# Altium schematic sheet Breakout.SchDoc
size A4; SheetNumber: 1; SheetTotal: 1
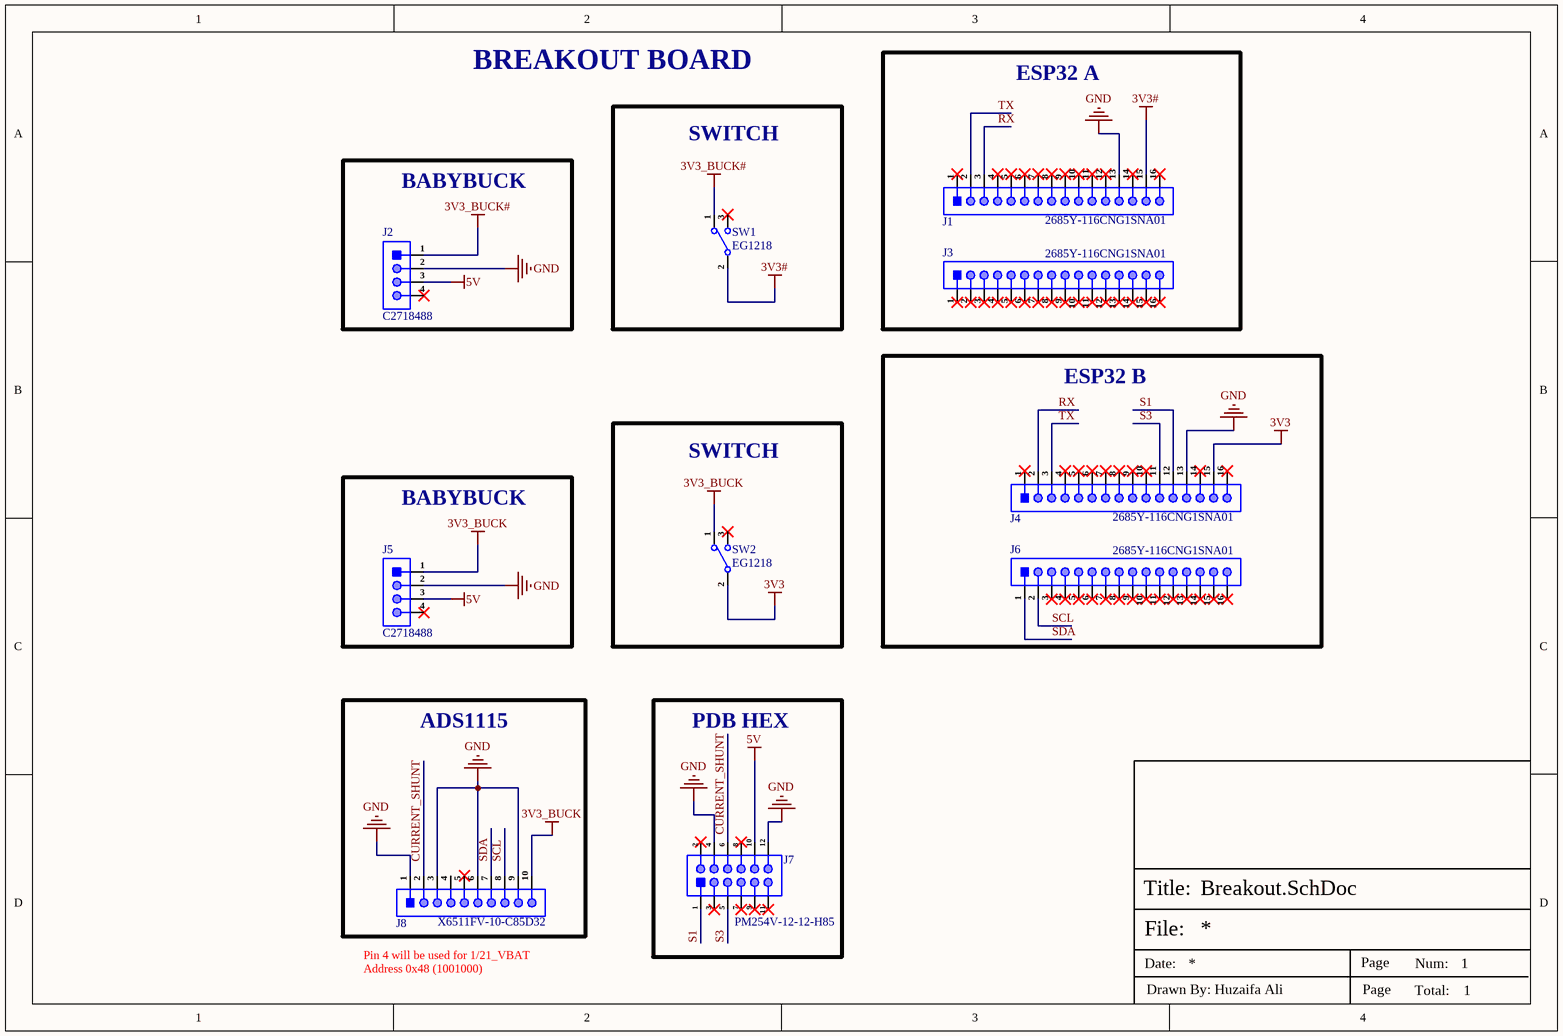
[diagram p0: Breakout.SchDoc]

## Parts
J1  2685Y-116CNG1SNA01  [HDR1X16 Female]
J2  C2718488  [HDR1X4 Female]
J3  2685Y-116CNG1SNA01  [HDR1X16 Female]
J4  2685Y-116CNG1SNA01  [HDR1X16 Female]
J5  C2718488  [HDR1X4 Female]
J6  2685Y-116CNG1SNA01  [HDR1X16 Female]
J7  PM254V-12-12-H85  [HDR2X6 Female]
J8  X6511FV-10-C85D32  [HDR1X10 Female]
SW1  EG1218  [EG1218]
SW2  EG1218  [EG1218]

## Blocks framed on the sheet
ESP32 A: J1 J3
SWITCH: SW1
BABYBUCK: J2
ESP32 B: J4 J6
SWITCH: SW2
BABYBUCK: J5
ADS1115: J8
PDB HEX: J7

## Nets
3V3: J4.15 SW2.2(COM)
3V3#: J1.15 SW1.2(COM)
3V3_BUCK: J5.1 J8.10 SW2.1(NC)
3V3_BUCK#: J2.1 SW1.1(NC)
5V: J2.3 J5.3 J7.10
GND: J1.13 J2.2 J4.13 J5.2 J7.4 J7.12 J8.1 J8.3 J8.6 J8.9
CURRENT_SHUNT: J7.6 J8.2
RX: J1.3 J4.2
S1: J4.12 J7.1
S3: J4.11 J7.5
SCL: J6.2 J8.8
SDA: J6.1 J8.7
TX: J1.2 J4.3

Not connected (* = marked no-connect by the designer): J1 1* 4* 5* 6* 7* 8* 9* 10* 11* 12* 14* 16*; J2 4*; J3 1* 2* 3* 4* 5* 6* 7* 8* 9* 10* 11* 12* 13* 14* 15* 16*; J4 1* 4* 5* 6* 7* 8* 9* 10* 14* 16*; J5 4*; J6 3* 4* 5* 6* 7* 8* 9* 10* 11* 12* 13* 14* 15* 16*; J7 2* 3* 7* 8* 9* 11*; J8 4 5*; SW1 3(NO)*; SW2 3(NO)*

## Notes on the sheet
- BREAKOUT BOARD
- Pin 4 will be used for 1/21_VBAT
- Address 0x48 (1001000)
- File:
- Title:
- Date:
- Page
- Num:
- Total:
- Drawn By: Huzaifa Ali

## Library data of the parts
J1 J3 J4 J6 = 2685Y-116CNG1SNA01: 2.54mm Plugin 16P Brass Straight 1x16P Plugin,P=2.54mm Female Headers ROHS; Manufacturer: HOAUC; Item Type: Header; Manufacturer Part Number: 2685Y-116CNG1SNA01; Package: Plugin,P=2.54mm; LCSC Part Number: C350305; ComponentLink1Description: LCSC; ComponentLink1URL: https://www.lcsc.com/product-detail/Female-Headers_HOAUC-2685Y-116CNG1SNA01_C350305.html
J2 J5 = C2718488: 2.54mm Plugin 3A bronze -40℃~+105℃ Straight 1x4P Top 4 Square Holes Plugin,P=2.54mm Female Headers ROHS; Manufacturer: BOOMELE; Item Type: Header; Manufacturer Part Number: C2718488; Package: Plugin,P=2.54mm; LCSC Part Number: C2718488; ComponentLink1Description: LCSC; ComponentLink1URL: https://www.lcsc.com/product-detail/Female-Headers_BOOMELE-Boom-Precision-Elec-C2718488_C2718488.html
J7 = PM254V-12-12-H85: 2.54mm 2.54mm 双排 12P Brass Straight 2x6P Plugin,P=2.54mm Female Headers ROHS; Manufacturer: XFCN; Item Type: Header; Manufacturer Part Number: PM254V-12-12-H85; Package: Plugin,P=2.54mm; LCSC Part Number: C541855; ComponentLink1Description: LCSC; ComponentLink1URL: https://www.lcsc.com/product-detail/Female-Headers_XFCN-PM254V-12-12-H85_C541855.html
J8 = X6511FV-10-C85D32: 2.54mm Plugin Gold 3A 10P Brass -40℃~+105℃ 250V 260℃ Straight 1x10P 8.5mm Top Square Holes Plugin,P=2.54mm Female Headers ROHS; Manufacturer: XKB Connectivity; Item Type: Header; Manufacturer Part Number: X6511FV-10-C85D32; Package: Plugin,P=2.54mm; LCSC Part Number: C718235; ComponentLink1Description: LCSC; ComponentLink1URL: https://www.lcsc.com/product-detail/Female-Headers_XKB-Connectivity-X6511FV-10-C85D32_C718235.html
SW1 SW2 = EG1218: Switch Slide N.O./N.C. SPDT Top Slide 0.2A 30VDC PC Pins Thru-Hole; Manufacturer: E-Switch; Voltage Rating (DC): 30V; Electrical Life: 10000Cycles; Switch Travel: 2.5mm; Switch Function: On-On; Actuator Type: Standard; Contact Current Rating: 200mA; Operating Force: 250gf; Illumination Type: Non-Illuminated; Number of Positions: 2; Insulation Resistance: 100R; Contact Resistance: 20mR; Actuator Length: 2mm; Supplier 1: Digi-Key; Manufacturer Part Number: EG1218; RoHS: Yes; Category: Slide Switches; Stock 1: 57148; Pricing 1: 1=0.76, 10=0.727, 25=0.6996, 100=0.6071, 250=0.55396, 500=0.51478, 1000=0.46162, 2500=0.43364, 5000=0.40287 (USD); Mount: Through Hole; Number of Pins: 3; Contact Material: Copper Alloy,Copper,Silver; Contact Plating: Silver; Min Operating Temperature: -20°C; Max Operating Temperature: 70°C; Throw Configuration: SPDT; Termination: PC Pin; Packaging: Bulk; Orientation: Straight; Series: EG; Voltage Rating (AC): 30V; Voltage Rating: 30V; Lead Free: Lead Free; RoHS Compliant: Yes; Reach SVHC Compliant: No; ComponentLink1URL: https://datasheet.ciiva.com/1699/p040040c-1699451.pdf?src-supplier=Newark; ComponentLink1Description: https://datasheet.ciiva.com/1699/p040040c-1699451.pdf?src-supplier=Newark; Item Type: *; LCSC Part Number: C273394; Supplier Part Number 1: EG1903-ND